# Altium schematic sheet MD-XTR-MOSFET.SchDoc
size 431 x 279 mm; SheetNumber: 6; SheetTotal: 7
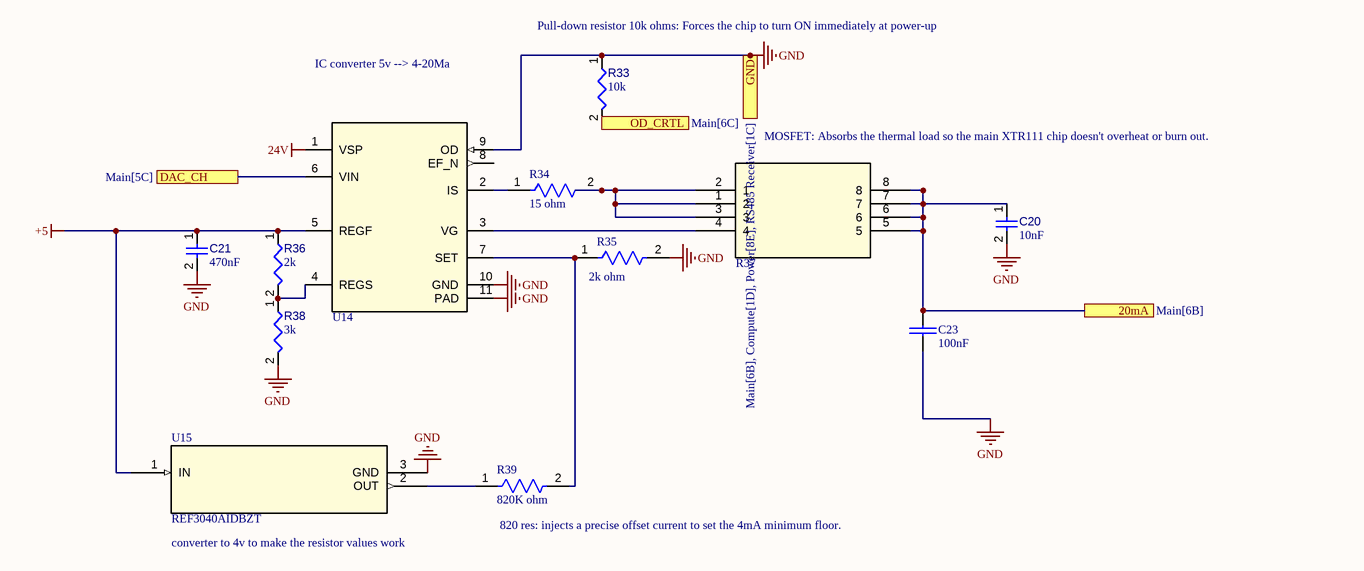
[diagram p0: MD-XTR-MOSFET.SchDoc]

## Parts
C20  value 10nF  [CAPC0402(1005)60_L]  (hidden comment: Capacitor 10nF +/-20% 50V 0402)
C21  value 470nF  [CAPC0402(1005)60_L]  (hidden comment: Capacitor 470nF +/-40% 10V 0402)
C23  value 100nF  [PCC-001-0015-1]  (hidden comment: Capacitor 15uF, 20%, 35V, X5R, 0805)
R33  value 10k  [RESC0402(1005)_L]  (hidden comment: 10KR2F)
R34  15 ohm  [FP-AF0603-IPC_C]
R35  2k ohm  [FP-RN73R1E-IPC_B]
R36  value 2k  [RESC0402(1005)_L]  (hidden comment: Resistor 2K +/-5 % 0402 63 mW)
R37  RRH100P03GZETB  [TRANS_RRH040P_ROM]  (value not drawn)
R38  value 3k  [RESC0402(1005)_L]  (hidden comment: Resistor 3K +/-1 % 0402 63 mW)
R39  820K ohm  [FP-CRGP0402-IPC_C]
U14  XTR111AIDRCR  [DRC0010A]  (value not drawn)
U15  REF3040AIDBZT  [DBZ3]

## Ports
20mA (see Main[6B]), DAC_CH (see Main[5C]), GND (see Main[6B], Compute[1D], Power[8E], RS485 Receiver[1C]), OD_CRTL (see Main[6C])

## Nets
24V: U14.1(VSP)
+5: C21.1 R36.1 U14.5(REGF) U15.1(IN)
GND: C20.2 C21.2 C23.2 R33.1 R35.2 R38.2 U14.9(OD) U14.10(GND) U14.11(PAD) U15.3(GND) ; port GND
20mA: C20.1 C23.1 R37.5 R37.6 R37.7 R37.8 ; port 20mA
DAC_CH: U14.6(VIN) ; port DAC_CH
OD_CRTL: R33.2 ; port OD_CRTL
NetR34_1: R34.1 U14.2(IS)
NetR34_2: R34.2 R37.1(2) R37.2(1) R37.3
NetR35_1: R35.1 R39.2 U14.7(SET)
NetR36_2: R36.2 R38.1 U14.4(REGS)
NetR37_4: R37.4 U14.3(VG)
NetR39_1: R39.1 U15.2(OUT)

Not connected (* = marked no-connect by the designer): U14 8(EF_N)

## Notes on the sheet
- (near R33) Pull-down resistor 10k ohms: Forces the chip to turn ON immediately at power-up
- IC converter 5v --> 4-20Ma
- MOSFET: Absorbs the thermal load so the main XTR111 chip doesn't overheat or burn out.
- converter to 4v to make the resistor values work
- (near R39) 820 res: injects a precise offset current to set the 4mA minimum floor.
- DWG. NO.
- REV.
- SHT.
- THIS DOCUMENT AND THE DATA DISCLOSED HEREIN OR HEREWITH IS THE PROPERTY OF ALTIUM LIMITED AND MAY BE FREELY DISTRIBUTED IN WHOLE. NO RIGHTS ARE RESERVED OR EXPRESS OR IMPLIED WARANTEE GIVEN.
- REVISION
- DESCRIPTION
- DATE
- APPROVED
- ENG:
- APPROVALS
- PROJECT
- DSN:
- CHK:
- REFERENCE DOCUMENTS
- PROJECT REVISION:
- TITLE
- DOCUMENT REVISION:
- DESIGN ITEM:
- BOM:
- FAB DWG:
- PCB DWG:
- ASSY DWG:
- SCALE:
- SIZE
- B
- CAGE CODE
- FILE NAME
- DWG NO.
- SHEET
- OF
- REV

## Library data of the parts
C20 = CMP-001-00069-3: Chip Capacitor, 10nF +/-20%, 50V, 0402, Thickness 0.6 mm; Tolerance: 5%; Max Operating Temperature: 85°C; Pins: 2; Case/Package: 0402; Voltage Rating: 50V; Min Operating Temperature: -55°C; Mounting Technology: SMT
C21 = CMP-001-00060-4: Chip Capacitor, 470nF +/-40%, 10V, 0402, Thickness 0.6 mm; Tolerance: 20%; Max Operating Temperature: 85°C; Case/Package: 0402; Voltage Rating: 10V; Min Operating Temperature: -55°C; Mounting Technology: SMT; Pins: 2
C23 = Capacitor 15uF, 20%, 35V, X5R, 0805-1: Capacitor, ceramic, 15uF, 20%, 35V, X5R, 0805; Manufacturer Part Number 1: GMC21X5R156M35NT; Manufacturer 1: Cal-Chip Electronics; Manufacturer 2: TDK; Supplier 2: LCSC; Package: 0805; Manufacturer Part Number 2: C2012X5R1V156MT000E; Supplier Part Number 2: C5367448; Tolerance: 20%; Supplier Part Number 1: 4713-GMC21X5R156M35NTCT-ND; Voltage: 35V; Supplier 1: DigiKey; Dielectric: X5R
R33 = CMP-009-00066-2: 10K 0.063W 1% 0402 (1005 Metric)  SMD; Power: 63mW; Case/Package: 0402; Mounting Technology: SMT; Pins: 2; Tolerance: 1%
R34 = CMP-03412-045241-1: Anti-Sulfurated Chip Resistors Automotive Grade 15Ω 1% 100ppm/°C 0603; Resistance: 15R; Max Power Dissipation: 100mW; Height: 0.022inch; Width: 0.031inch; Tolerance: 1%; Resistor Type: Thick Film; Features: Moisture Resistant; RoHS Compliant: Yes; Length: 0.063inch; Min Operating Temperature: -55°C; Number of Terminations: 2; Temperature Coefficient: 100ppm/°C; Packaging: Tape and Reel; Case/Package: 0603; Series: AF; Max Operating Temperature: 155°C
R35 = CMP-04015-046600-1: 2kΩ ±1% 0.063W, 1/16W Chip Resistor 0402 (1005 Metric) Moisture Resistant Thin Film
R36 = CMP-009-00138-3: Chip Resistor, 2 kOhms, +/-5 %, 63 mW, -55 to 155 degC, 0402; Tolerance: 5%; Power: 63mW; Max Operating Temperature: 155°C; Pins: 2; Min Operating Temperature: -55°C; Case/Package: 0402
R37 = CMP-009-00252-1: No Description Available; Manufacturer_Name: ROHM Semiconductor; RefDes: RefDes; Type: Type; Copyright: Copyright (C) 2026 Ultra Librarian. All rights reserved.; Source: RRH100P03GZETB.SchLib; Manufacturer_Part_Number: RRH100P03GZETB; Design Item ID: RRH100P03GZETB
R38 = CMP-009-00145-3: Chip Resistor, 3 kOhms, +/-1 %, 63 mW, -55 to 155 degC, 0402; Tolerance: 1%; Power: 63mW; Case/Package: 0402; Min Operating Temperature: -55°C; Max Operating Temperature: 155°C; Pins: 2
R39 = CMP-03211-002910-1: CRGP0402 820KΩ 0.125W ±100ppm/°C 1% 50V; Manufacturer: TE; Manufacturer Part Number: CRGP0402F820K; Tolerance: 0.01; Ipc Land Pattern Name: RESC11050X35; Composition: Thick Film; RoHS: TRUE; Temperature Range Low: -55°C; Temperature Coefficient: ±100ppm/°C; ComponentLink2URL: https://www.mouser.ca/datasheet/2/418/NG_DS_9-1773463-9_A-1358566.pdf; Value: 820KΩ; Series: CRGP; Lead Free: Yes; Voltage Rating: 50V; Power Rating: 0.125W; Resistance: 820KΩ; Automotive: No; Temperature Range High: +155°C; Package: CRGP0402; Device Class L1: Passive Components; Octopart: https://octopart.com/crgp0402f820k-te+connectivity-91018714; Temperature: -55°C to +155°C; Device Class L2: Resistors; Device Class L3: Chip SMD Resistors; Category: Res; ComponentLink2Description: Datasheet; Height: 0.4mm
U14 = CMP-009-00251-1: Voltage-to-current converter/transmitter with 3-V to 15-V regulator and resistor set I/O ratio 10-VSON -40 to 125; PartNumber: XTR111AIDRCT; Manufacturer_Name: Texas Instruments; CompType: IC; Copyright: Copyright (C) 2025 Ultra Librarian. All rights reserved.; MountType: SMT; RoHS: Y; Source: XTR111AIDRCR.SchLib; Design Item ID: XTR111AIDRCR; Application_BuildNumber: *; Manufacturer: Texas Instruments; Case/Package: DRC0010A; RefDes: RefDes; TYPE: TYPE; Manufacturer_Part_Number: XTR111AIDRCR
U15 = CMP-256-000000-1: 50ppm/Â°C drift, 50ÂµA Iq in SOT-23-3 package series voltage reference 3-SOT-23 -40 to 125; Manufacturer_Name: Texas Instruments; Type: Type; Manufacturer_Part_Number: REF3040AIDBZT; Source: REF3040AIDBZT.SchLib; Copyright: Copyright (C) 2025 Ultra Librarian. All rights reserved.; Design Item ID: REF3040AIDBZT; RefDes: RefDes